# Altium schematic sheet RS485.SchDoc
size A; SheetNumber: 6; SheetTotal: 6
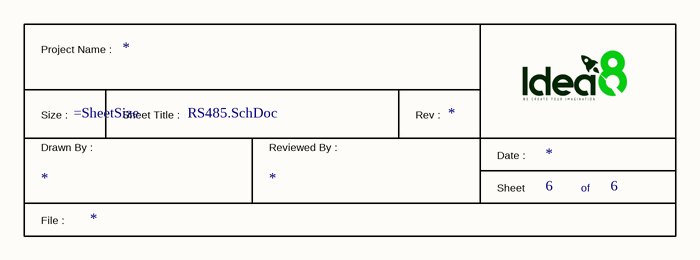
[diagram p0: RS485.SchDoc]

## Parts
*  TitleBlock1  (value not drawn)  (graphical)

## Notes on the sheet
- (in symbol TitleBlock1) Project Name :; Size :; Sheet Title :; Rev :; Drawn By :; Reviewed By :; Date :; Sheet; of; File :